# Altium schematic sheet Battery-Current.SchDoc
size B; SheetNumber: 4; SheetTotal: 4
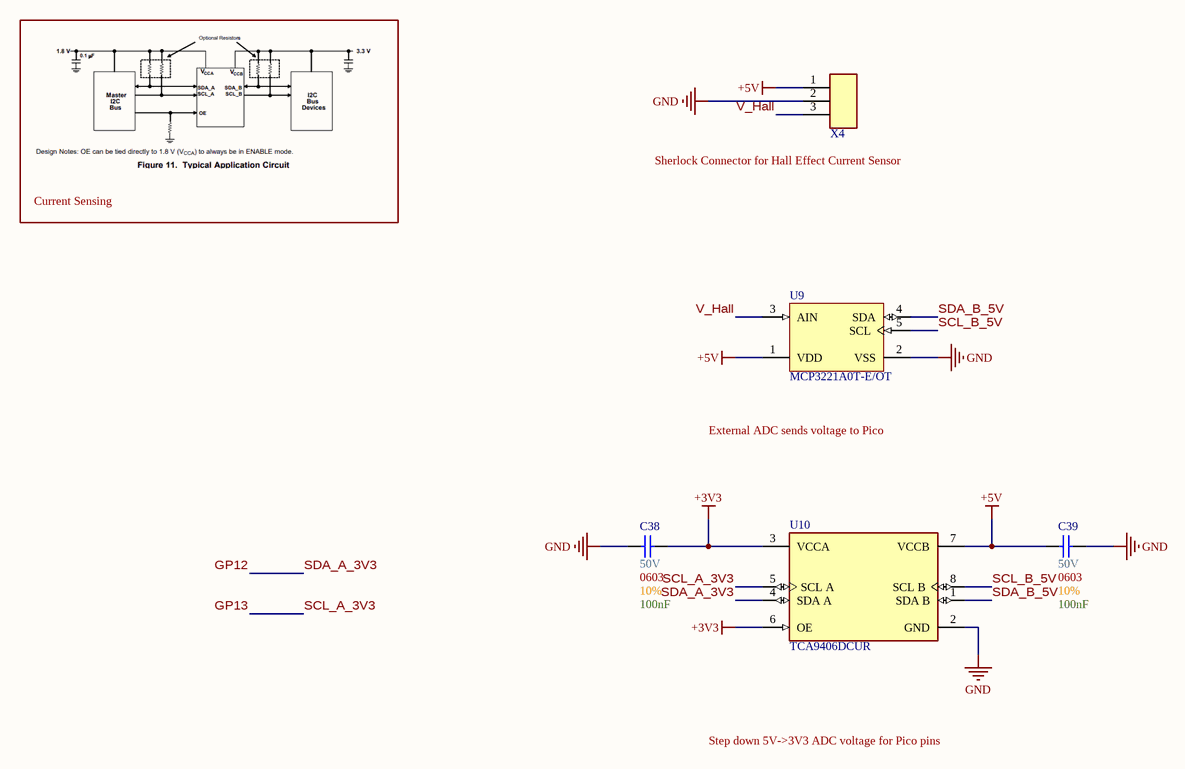
[diagram p0: Battery-Current.SchDoc]

## Parts
C38  Max Voltage: 50V  Size Package: 0603  Tolerance: 10%  Capacitance: 100nF  [[Cap] SMD 0603]  (hidden comment: [Cap] 0603 0.1uF 10% 50V)
C39  Max Voltage: 50V  Size Package: 0603  Tolerance: 10%  Capacitance: 100nF  [[Cap] SMD 0603]  (hidden comment: [Cap] 0603 0.1uF 10% 50V)
U9  MCP3221A0T-E/OT  [SOT-23-OT5_N]
U10  TCA9406DCUR  [FP-DCU0008A-IPC_B]
X4  [Sherlock] 3pin  [[Sherlock] 3pin]  (value not drawn)

## Nets
+3V3: C38.2 U10.3(VCCA) U10.6(OE)
+5V: C39.1 U9.1(VDD) U10.7(VCCB) X4.1
GND: C38.1 C39.2 U9.2(VSS) U10.2(GND) X4.2
GP12: U10.4(SDA_A)  [also labelled SDA_A_3V3]
GP13: U10.5(SCL_A)  [also labelled SCL_A_3V3]
SCL_B_5V: U9.5(SCL) U10.8(SCL_B)
SDA_B_5V: U9.4(SDA) U10.1(SDA_B)
V_Hall: U9.3(AIN) X4.3

## Notes on the sheet
- (near X4) Sherlock Connector for Hall Effect Current Sensor
- Current Sensing
- External ADC sends voltage to Pico
- Step down 5V->3V3 ADC voltage for Pico pins

## Library data of the parts
C38 C39 = [Cap] 0603 0.1uF 10% 50V: GCM155R71H104KE02J; Supplier 1: DigiKey; Supplier Part Number 1: 490-14514-6-ND
U9 = CMP-0188-00714-2: Low Power 12-Bit A/D Converter With I2C Interface, 5-Pin SOT-23, Extended Temperature, Tape and Reel; PackageVersion: revBB, Aug-2009; ComponentLink1URL: http://www.microchip.com/; ComponentLink1Description: Manufacturer URL; RevisionNote: URLs added.; ComponentLink3URL: http://www.microchip.com/stellent/groups/techpub_sg/documents/packagingspec/en012702.pdf; ComponentLink2Description: Datasheet; ComponentLink3Description: Package Specification; PackageReference: SOT-23-OT5; PackageDescription: 5-Lead Plastic Small Outline Transistor (OT) [SOT-23]; ComponentLink2URL: http://ww1.microchip.com/downloads/en/DeviceDoc/21732c.pdf; DatasheetVersion: revC, Jul-2006; Code_IPC: SOT23-5
U10 = CMP-0314-00417-3: IC TRNSLTR BIDIRECTIONAL US8; Propagation Delay: 4.4ns; Min Supply Voltage: 1.65V; Low Level Output Current: 50mA; Logic Function: Translator; Data Rate: 24Mbps; Turn-On Delay Time: 260ns; Max Supply Voltage: 5.5V; Number of Channels: 2; High Level Output Current: -50mA; Output Type: Voltage; Number of Pins: 8; Weight: 0.00067oz; Lead Free: Lead Free; Case/Package: VSSOP; Packaging: Tape and Reel; REACH SVHC: No SVHC; Package Quantity: 1; Length: 2.1mm; Contact Plating: Gold; Width: 2.4mm; Radiation Hardening: No; Number of Bits: 2; Height: 0.8mm; Number of Outputs: 2; Max Operating Temperature: 85°C; Min Operating Temperature: -40°C
X4 = [Sherlock] 3pin: 0353620350; Supplier 1: DigiKey; Supplier Part Number 1: WM18921-ND